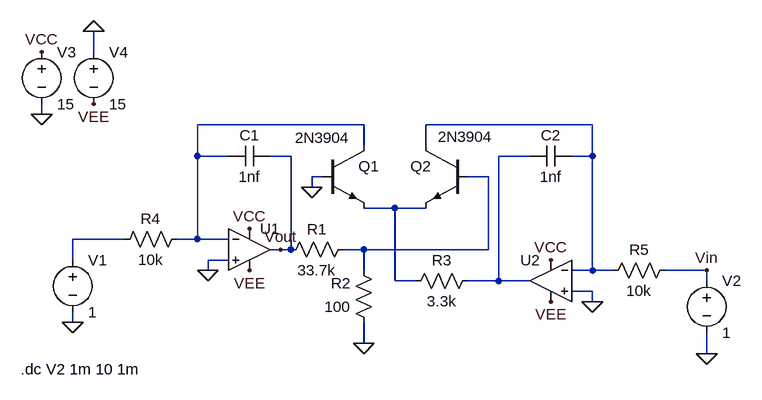
[diagram p0: schematic Draft4.asc]
Draft4.asc, the LTspice schematic file:
Version 4.1
SHEET 1 880 680
WIRE -144 -128 -144 -160
WIRE -224 -32 -224 -48
WIRE 272 -16 16 -16
WIRE 624 -16 368 -16
WIRE 272 16 272 -16
WIRE 368 16 368 -16
WIRE 16 32 16 -16
WIRE 64 32 16 32
WIRE 160 32 128 32
WIRE 528 32 480 32
WIRE 624 32 624 -16
WIRE 624 32 592 32
WIRE 208 64 192 64
WIRE 464 64 432 64
WIRE 192 80 192 64
WIRE 320 112 272 112
WIRE 368 112 320 112
WIRE -96 160 -176 160
WIRE 16 160 16 32
WIRE 16 160 -16 160
WIRE 64 160 16 160
WIRE 144 176 128 176
WIRE 160 176 160 32
WIRE 160 176 144 176
WIRE 272 176 240 176
WIRE 464 176 464 64
WIRE 464 176 272 176
WIRE -176 192 -176 160
WIRE 64 192 32 192
WIRE 32 208 32 192
WIRE 272 208 272 176
WIRE 624 208 624 32
WIRE 624 208 592 208
WIRE 656 208 624 208
WIRE 800 208 736 208
WIRE 320 224 320 112
WIRE 352 224 320 224
WIRE 480 224 480 32
WIRE 480 224 432 224
WIRE 528 224 480 224
WIRE 800 224 800 208
WIRE 624 240 592 240
WIRE 624 256 624 240
WIRE -176 288 -176 272
WIRE 272 320 272 288
WIRE 800 336 800 304
FLAG 192 80 0
FLAG 624 256 0
FLAG 32 208 0
FLAG 272 320 0
FLAG -176 288 0
FLAG 800 336 0
FLAG -224 -32 0
FLAG -144 -160 0
FLAG -224 -128 VCC
FLAG 96 144 VCC
FLAG 560 192 VCC
FLAG -144 -48 VEE
FLAG 96 208 VEE
FLAG 560 256 VEE
FLAG 144 176 Vout
FLAG 800 208 Vin
SYMBOL OpAmps\\UniversalOpAmp2 96 176 R0
SYMATTR InstName U1
SYMBOL OpAmps\\UniversalOpAmp2 560 224 M0
SYMATTR InstName U2
SYMBOL res 256 160 R90
WINDOW 0 0 56 VBottom 2
WINDOW 3 32 56 VTop 2
SYMATTR InstName R1
SYMATTR Value 33.7k
SYMBOL res 288 304 R180
WINDOW 0 36 76 Left 2
WINDOW 3 36 40 Left 2
SYMATTR InstName R2
SYMATTR Value 100
SYMBOL npn 208 16 R0
WINDOW 3 -42 -12 Left 2
SYMATTR InstName Q1
SYMATTR Value 2N3904
SYMBOL npn 432 16 M0
WINDOW 3 -39 -14 Left 2
SYMATTR InstName Q2
SYMATTR Value 2N3904
SYMBOL res 448 208 R90
WINDOW 0 0 56 VBottom 2
WINDOW 3 32 56 VTop 2
SYMATTR InstName R3
SYMATTR Value 3.3k
SYMBOL cap 128 16 R90
WINDOW 0 0 32 VBottom 2
WINDOW 3 32 32 VTop 2
SYMATTR InstName C1
SYMATTR Value 1nf
SYMBOL cap 592 16 R90
WINDOW 0 0 32 VBottom 2
WINDOW 3 32 32 VTop 2
SYMATTR InstName C2
SYMATTR Value 1nf
SYMBOL res 0 144 R90
WINDOW 0 0 56 VBottom 2
WINDOW 3 32 56 VTop 2
SYMATTR InstName R4
SYMATTR Value 10k
SYMBOL res 752 192 R90
WINDOW 0 0 56 VBottom 2
WINDOW 3 32 56 VTop 2
SYMATTR InstName R5
SYMATTR Value 10k
SYMBOL voltage -176 176 R0
WINDOW 123 0 0 Left 0
WINDOW 39 0 0 Left 0
SYMATTR InstName V1
SYMATTR Value 1
SYMBOL voltage 800 208 R0
WINDOW 123 0 0 Left 0
WINDOW 39 0 0 Left 0
SYMATTR InstName V2
SYMATTR Value 1
SYMBOL voltage -224 -144 R0
WINDOW 123 0 0 Left 0
WINDOW 39 0 0 Left 0
SYMATTR InstName V3
SYMATTR Value 15
SYMBOL voltage -144 -144 R0
WINDOW 123 0 0 Left 0
WINDOW 39 0 0 Left 0
SYMATTR InstName V4
SYMATTR Value 15
TEXT -256 360 Left 2 !.dc V2 1m 10 1m

The netlist it stands for:
* Draft4.asc
X§U1 0 N001 VCC VEE Vout level2 Avol=1Meg GBW=10Meg Slew=10Meg Ilimit=25m Rail=0 Vos=0 En=0 Enk=0 In=0 Ink=0 Rin=500Meg  ; pins In+ In- V+ V- OUT
X§U2 0 N002 VCC VEE N003 level2 Avol=1Meg GBW=10Meg Slew=10Meg Ilimit=25m Rail=0 Vos=0 En=0 Enk=0 In=0 Ink=0 Rin=500Meg  ; pins In+ In- V+ V- OUT
R1 N004 Vout 33.7k
R2 0 N004 100
Q1 N001 0 N005 0 2N3904
Q2 N002 N004 N005 0 2N3904
R3 N003 N005 3.3k
C1 Vout N001 1nf
C2 N002 N003 1nf
R4 N001 N006 10k
R5 Vin N002 10k
V1 N006 0 1
V2 Vin 0 1
V3 VCC 0 15
V4 0 VEE 15
.model NPN NPN
.model PNP PNP
.lib standard.bjt
.dc V2 1m 10 1m
.lib UniversalOpAmp2.lib
.backanno
.end